# Altium schematic sheet CM5_GPIO.SchDoc: 03 - CM5: conector 1 / 100 pinos
size A3; Project: CM5 Photonic Bias Controller; DocumentRev: R5; ProjectRev: R5; Version: Rev R6; SheetNumber: 4; SheetTotal: 17; Author: Carlos Renan; SCH_SCALE: N/A; Address1: UFCG; Address2: Referencia: VIRTUS CC; Address3: Campina Grande - PB; ProjectName: Controle automatico de BIAS para MZM/IQ - Projeto 3; DocumentName: CM5_GPIO.SchDoc
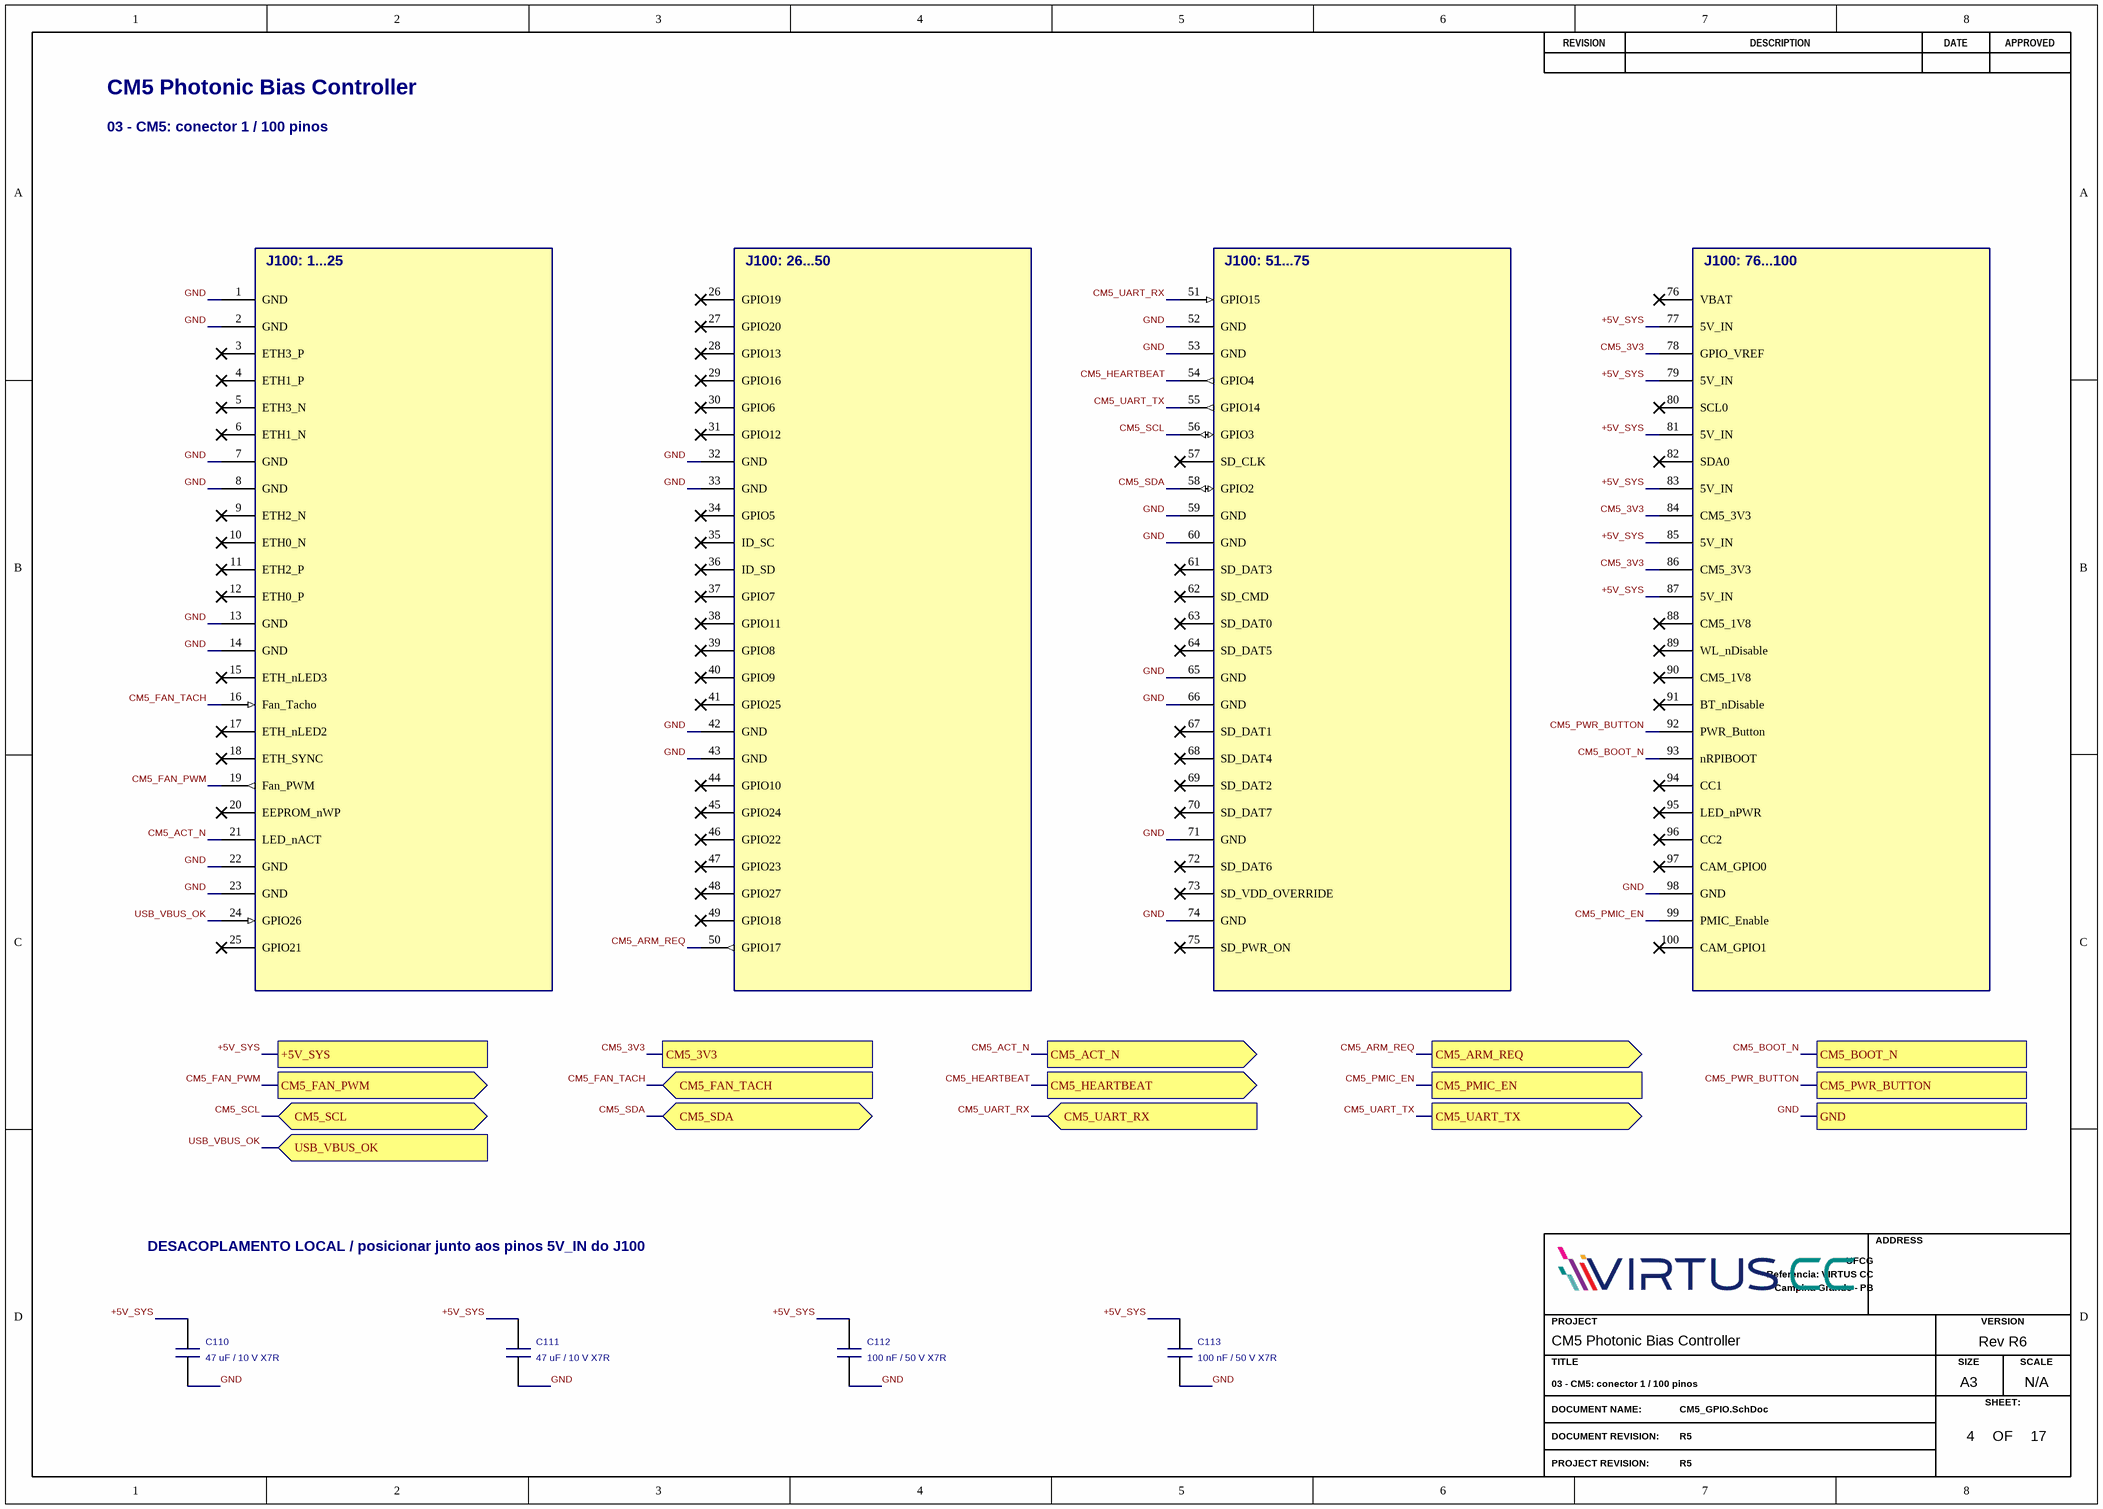
[diagram p0: CM5_GPIO.SchDoc]

## Parts
C110  47 uF / 10 V X7R  [C1210]
C111  47 uF / 10 V X7R  [C1210]
C112  100 nF / 50 V X7R  [C0805]
C113  100 nF / 50 V X7R  [C0805]
J100  CM5 carrier / 100 vias  [CM5_BERG100]  (value not drawn)

## Ports
+5V_SYS, CM5_3V3, CM5_ACT_N (out), CM5_ARM_REQ (out), CM5_BOOT_N, CM5_FAN_PWM (out), CM5_FAN_TACH (in), CM5_HEARTBEAT (out), CM5_PMIC_EN, CM5_PWR_BUTTON, CM5_SCL (bidir), CM5_SDA (bidir), CM5_UART_RX (in), CM5_UART_TX (out), GND, USB_VBUS_OK (in)

## Nets
+5V_SYS: C110.1 C111.1 C112.1 C113.1 J100.77(5V_IN) J100.79(5V_IN) J100.81(5V_IN) J100.83(5V_IN) J100.85(5V_IN) J100.87(5V_IN) ; port +5V_SYS
CM5_3V3: J100.78(GPIO_VREF) J100.84(CM5_3V3) J100.86(CM5_3V3) ; port CM5_3V3
CM5_ACT_N: J100.21(LED_nACT) ; port CM5_ACT_N
CM5_ARM_REQ: J100.50(GPIO17) ; port CM5_ARM_REQ
CM5_BOOT_N: J100.93(nRPIBOOT) ; port CM5_BOOT_N
CM5_FAN_PWM: J100.19(Fan_PWM) ; port CM5_FAN_PWM
CM5_FAN_TACH: J100.16(Fan_Tacho) ; port CM5_FAN_TACH
CM5_HEARTBEAT: J100.54(GPIO4) ; port CM5_HEARTBEAT
CM5_PMIC_EN: J100.99(PMIC_Enable) ; port CM5_PMIC_EN
CM5_PWR_BUTTON: J100.92(PWR_Button) ; port CM5_PWR_BUTTON
CM5_SCL: J100.56(GPIO3) ; port CM5_SCL
CM5_SDA: J100.58(GPIO2) ; port CM5_SDA
CM5_UART_RX: J100.51(GPIO15) ; port CM5_UART_RX
CM5_UART_TX: J100.55(GPIO14) ; port CM5_UART_TX
GND: C110.2 C111.2 C112.2 C113.2 J100.1(GND) J100.2(GND) J100.7(GND) J100.8(GND) J100.13(GND) J100.14(GND) J100.22(GND) J100.23(GND) J100.32(GND) J100.33(GND) J100.42(GND) J100.43(GND) J100.52(GND) J100.53(GND) J100.59(GND) J100.60(GND) J100.65(GND) J100.66(GND) J100.71(GND) J100.74(GND) J100.98(GND) ; port GND
USB_VBUS_OK: J100.24(GPIO26) ; port USB_VBUS_OK

Not connected (* = marked no-connect by the designer): J100 3(ETH3_P)* 4(ETH1_P)* 5(ETH3_N)* 6(ETH1_N)* 9(ETH2_N)* 10(ETH0_N)* 11(ETH2_P)* 12(ETH0_P)* 15(ETH_nLED3)* 17(ETH_nLED2)* 18(ETH_SYNC)* 20(EEPROM_nWP)* 25(GPIO21)* 26(GPIO19)* 27(GPIO20)* 28(GPIO13)* 29(GPIO16)* 30(GPIO6)* 31(GPIO12)* 34(GPIO5)* 35(ID_SC)* 36(ID_SD)* 37(GPIO7)* 38(GPIO11)* 39(GPIO8)* 40(GPIO9)* 41(GPIO25)* 44(GPIO10)* 45(GPIO24)* 46(GPIO22)* 47(GPIO23)* 48(GPIO27)* 49(GPIO18)* 57(SD_CLK)* 61(SD_DAT3)* 62(SD_CMD)* 63(SD_DAT0)* 64(SD_DAT5)* 67(SD_DAT1)* 68(SD_DAT4)* 69(SD_DAT2)* 70(SD_DAT7)* 72(SD_DAT6)* 73(SD_VDD_OVERRIDE)* 75(SD_PWR_ON)* 76(VBAT)* 80(SCL0)* 82(SDA0)* 88(CM5_1V8)* 89(WL_nDisable)* 90(CM5_1V8)* 91(BT_nDisable)* 94(CC1)* 95(LED_nPWR)* 96(CC2)* 97(CAM_GPIO0)* 100(CAM_GPIO1)*

## Notes on the sheet
- CM5 Photonic Bias Controller
- 03 - CM5: conector 1 / 100 pinos
- DESACOPLAMENTO LOCAL / posicionar junto aos pinos 5V_IN do J100
- REVISION
- DESCRIPTION
- DATE
- APPROVED
- ADDRESS
- PROJECT
- VERSION
- TITLE
- A3
- SIZE
- SCALE
- DOCUMENT NAME:
- DOCUMENT REVISION:
- OF
- SHEET:
- PROJECT REVISION:
- (in symbol CM5 carrier) J100: 1...25; J100: 26...50; J100: 51...75; J100: 76...100

## Library data of the parts
C110 C111 = 47 uF: Manufacturer: Murata; Manufacturer Part Number: GRM32ER71A476KE15L; Procurement Status: Busca por MPN; SKU e disponibilidade a confirmar; BOM Purchase: Yes; Manufacturer 1: Murata; Manufacturer Part Number 1: GRM32ER71A476KE15L; Supplier 1: DigiKey; Supplier URL 1: https://www.digikey.com.br/pt/products/result?keywords=GRM32ER71A476KE15L; Supplier 2: Mouser; Supplier URL 2: https://br.mouser.com/c/?q=GRM32ER71A476KE15L; Datasheet: https://www.murata.com/en-us/products/productdetail?partno=GRM32ER71A476KE15L
C112 C113 = 100 nF: Manufacturer: KEMET; Manufacturer Part Number: C0805C104K5RACTU; Procurement Status: Busca por MPN; SKU e disponibilidade a confirmar; BOM Purchase: Yes; Manufacturer 1: KEMET; Manufacturer Part Number 1: C0805C104K5RACTU; Supplier 1: DigiKey; Supplier URL 1: https://www.digikey.com.br/pt/products/result?keywords=C0805C104K5RACTU; Supplier 2: Mouser; Supplier URL 2: https://br.mouser.com/c/?q=C0805C104K5RACTU; Datasheet: https://www.yageogroup.com/download/specsheet/C0805C104K5RACTU
J100 = CM5 carrier: Manufacturer: Amphenol Communications Solutions; Manufacturer Part Number: 10164227-1004A1RLF; Review: 100 vias, passo 0,4 mm, empilhamento 4 mm. Pads locais 1..100; J101 corresponde aos pinos globais 101..200.; Procurement Status: Busca por MPN; SKU e disponibilidade a confirmar; BOM Purchase: Yes; Manufacturer 1: Amphenol Communications Solutions; Manufacturer Part Number 1: 10164227-1004A1RLF; Supplier 1: DigiKey; Supplier URL 1: https://www.digikey.com.br/pt/products/result?keywords=10164227-1004A1RLF; Supplier 2: Mouser; Supplier URL 2: https://br.mouser.com/c/?q=10164227-1004A1RLF; Datasheet: https://cdn.amphenol-cs.com/media/wysiwyg/files/drawing/10164227.pdf